# Altium schematic sheet Sheet1.SchDoc
size A; SheetNumber: 1; SheetTotal: 7
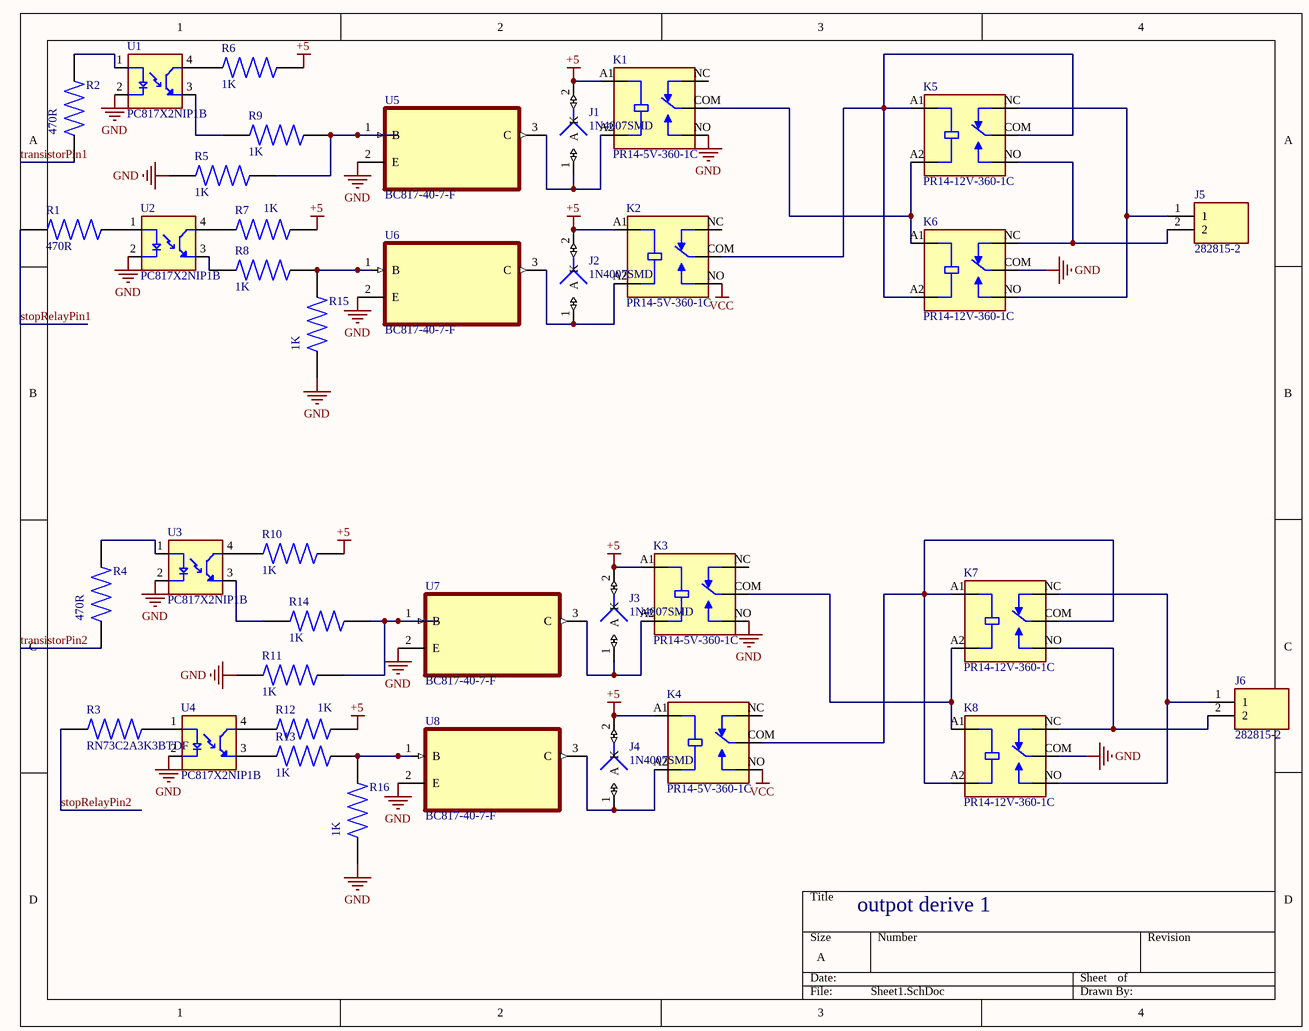
[diagram p0: Sheet1.SchDoc]

## Parts
J1  1N4007SMD  [C1206]
J2  1N4007SMD  [C1206]
J3  1N4007SMD  [C1206]
J4  1N4007SMD  [C1206]
J5  282815-2  [TE_282815-2]
J6  282815-2  [TE_282815-2]
K1  PR14-5V-360-1C  [RELAY_PR14-5V-360-1C]
K2  PR14-5V-360-1C  [RELAY_PR14-5V-360-1C]
K3  PR14-5V-360-1C  [RELAY_PR14-5V-360-1C]
K4  PR14-5V-360-1C  [RELAY_PR14-5V-360-1C]
K5  PR14-12V-360-1C  [RELAY_PR14-5V-360-1C]
K6  PR14-12V-360-1C  [RELAY_PR14-5V-360-1C]
K7  PR14-12V-360-1C  [RELAY_PR14-5V-360-1C]
K8  PR14-12V-360-1C  [RELAY_PR14-5V-360-1C]
R1  470R  [RESC2012X65N]
R2  470R  [RESC2012X65N]
R3  RN73C2A3K3BTDF  [RESC2012X65N]
R4  470R  [RESC2012X65N]
R5  1K  [RESC2012X65N]
R6  1K  [RESC2012X65N]
R7  1K  [RESC2012X65N]
R8  1K  [RESC2012X65N]
R9  1K  [RESC2012X65N]
R10  1K  [RESC2012X65N]
R11  1K  [RESC2012X65N]
R12  1K  [RESC2012X65N]
R13  1K  [RESC2012X65N]
R14  1K  [RESC2012X65N]
R15  1K  [RESC2012X65N]
R16  1K  [RESC2012X65N]
U1  PC817X2NIP1B  [SOIC254P960X420-4N]
U2  PC817X2NIP1B  [SOIC254P960X420-4N]
U3  PC817X2NIP1B  [SOIC254P960X420-4N]
U4  PC817X2NIP1B  [SOIC254P960X420-4N]
U5  BC817-40-7-F  [SOT103P240X110-3N]
U6  BC817-40-7-F  [SOT103P240X110-3N]
U7  BC817-40-7-F  [SOT103P240X110-3N]
U8  BC817-40-7-F  [SOT103P240X110-3N]

## Nets
+5: J1.2(K) J2.2(K) J3.2(K) J4.2(K) K1.A1(COIL1) K2.A1(COIL1) K3.A1(COIL1) K4.A1(COIL1) R6.2 R7.2 R10.2 R12.2
GND: K1.NO K3.NO K6.COM K8.COM R5.1 R11.1 R15.1 R16.1 U1.2(C) U2.2(C) U3.2(C) U4.2(C) U5.2(E) U6.2(E) U7.2(E) U8.2(E)
VCC: K2.NO K4.NO
stopRelayPin1: R1.1
stopRelayPin2: R3.1
transistorPin1: R2.1
transistorPin2: R4.1
NetJ1_1: J1.1(A) K1.A2(COIL2) U5.3(C)
NetJ2_1: J2.1(A) K2.A2(COIL2) U6.3(C)
NetJ3_1: J3.1(A) K3.A2(COIL2) U7.3(C)
NetJ4_1: J4.1(A) K4.A2(COIL2) U8.3(C)
NetJ5_1: J5.1 K5.NC K6.NO
NetJ5_2: J5.2 K5.NO K6.NC
NetJ6_1: J6.1 K7.NC K8.NO
NetJ6_2: J6.2 K7.NO K8.NC
NetK1_COM: K1.COM K5.A2(COIL2) K6.A1(COIL1)
NetK2_COM: K2.COM K5.A1(COIL1) K5.COM K6.A2(COIL2)
NetK3_COM: K3.COM K7.A2(COIL2) K8.A1(COIL1)
NetK4_COM: K4.COM K7.A1(COIL1) K7.COM K8.A2(COIL2)
NetR1_2: R1.2 U2.1(A)
NetR2_2: R2.2 U1.1(A)
NetR3_2: R3.2 U4.1(A)
NetR4_2: R4.2 U3.1(A)
NetR5_2: R5.2 R9.2 U5.1(B)
NetR6_1: R6.1 U1.4(CT)
NetR7_1: R7.1 U2.4(CT)
NetR8_1: R8.1 U2.3(ET)
NetR8_2: R8.2 R15.2 U6.1(B)
NetR9_1: R9.1 U1.3(ET)
NetR10_1: R10.1 U3.4(CT)
NetR11_2: R11.2 R14.2 U7.1(B)
NetR12_1: R12.1 U4.4(CT)
NetR13_1: R13.1 U4.3(ET)
NetR13_2: R13.2 R16.2 U8.1(B)
NetR14_1: R14.1 U3.3(ET)

Not connected (* = marked no-connect by the designer): K1 NC; K2 NC; K3 NC; K4 NC

## Notes on the sheet
- outpot derive 1

## Library data of the parts
J1-J4 = 1N4007SMD: RECTIFIER, 1KV, 1A, DO-214AC; Available until stocks are exhausted Alternatives available; MF: Multicomp Pro; Availability: Not in stock; Check_prices: https://www.snapeda.com/parts/1N4007SMD/Multicomp/view-part/?ref=eda; Package: None; SnapEDA_Link: https://www.snapeda.com/parts/1N4007SMD/Multicomp/view-part/?ref=snap; MP: 1N4007SMD; Price: None; Value: *
J5 J6 = 282815-2: 2 Position Terminal Block Header, Male Pins, Shrouded (2 Side) 0.200 (5.08mm) 90Â°, Right Angle - Through Hole; MF: TE Connectivity; SnapEDA_Link: https://www.snapeda.com/parts/282815-2/TE+Connectivity+AMP+Connectors/view-part/?ref=snap; Package: None; Value: *; MP: 282815-2; EU_RoHS_Compliance: Compliant with Exemptions; Check_prices: https://www.snapeda.com/parts/282815-2/TE+Connectivity+AMP+Connectors/view-part/?ref=eda
K1-K8 = PR14-5V-360-1C: 19 x 15.5 x 15.8 mm, 5 V, 10 A, SPDT (1 Form C), Power Relay; MF: Same Sky; SnapEDA_Link: https://www.snapeda.com/parts/PR14-5V-360-1C/Same+Sky/view-part/?ref=snap; Package: None; Value: *; MP: PR14-5V-360-1C; Check_prices: https://www.snapeda.com/parts/PR14-5V-360-1C/Same+Sky/view-part/?ref=eda
R1-R16 = RN73C2A3K3BTDF: TE; IND Devices; Resistors; RN 0805 3K3 0.1% 10PPM 1K RL | TE Connectivity RN73C2A3K3BTDF; Power_Rating: .1 W; Resistance: 3.3K; Voltage_Rating: 100 V; Tolerance: .1%; SnapEDA_Link: https://www.snapeda.com/parts/RN73C2A3K3BTDF/TE+Connectivity/view-part/?ref=snap; Package: 0805; Value: *; MF: TE Connectivity; MP: RN73C2A3K3BTDF; EU_RoHS_Compliance: Compliant; Check_prices: https://www.snapeda.com/parts/RN73C2A3K3BTDF/TE+Connectivity/view-part/?ref=eda
U1-U4 = PC817X2NIP1B: Optocoupler DC-IN 1-CH Transistor DC-OUT 4-Pin DIP SMD T/R; MF: Sharp Microelectronics; SnapEDA_Link: https://www.snapeda.com/parts/PC817X2NIP1B/Sharp+Microelectronics/view-part/?ref=snap; Package: SMD-4 Sharp Microelectronics; Value: *; MP: PC817X2NIP1B; Check_prices: https://www.snapeda.com/parts/PC817X2NIP1B/Sharp+Microelectronics/view-part/?ref=eda
U5-U8 = BC817-40-7-F: Bipolar (BJT) Transistor NPN 45 V 500 mA 100MHz 310 mW Surface Mount SOT-23-3; MF: Diodes Inc.; MP: BC817-40-7-F; Price: None; Package: SOT-23 Diodes Inc.; Check_prices: https://www.snapeda.com/parts/BC817-40-7-F/Diodes+Inc./view-part/?ref=eda; Value: *; Availability: In Stock; Purchase-URL: https://pricing.snapeda.com/search/part/BC817-40-7-F/?ref=eda; SnapEDA_Link: https://www.snapeda.com/parts/BC817-40-7-F/Diodes+Inc./view-part/?ref=snap